# EAGLE board powermodule (EAGLE 9.6.2)
PCB_VERSION: Powermodule V6.2.1
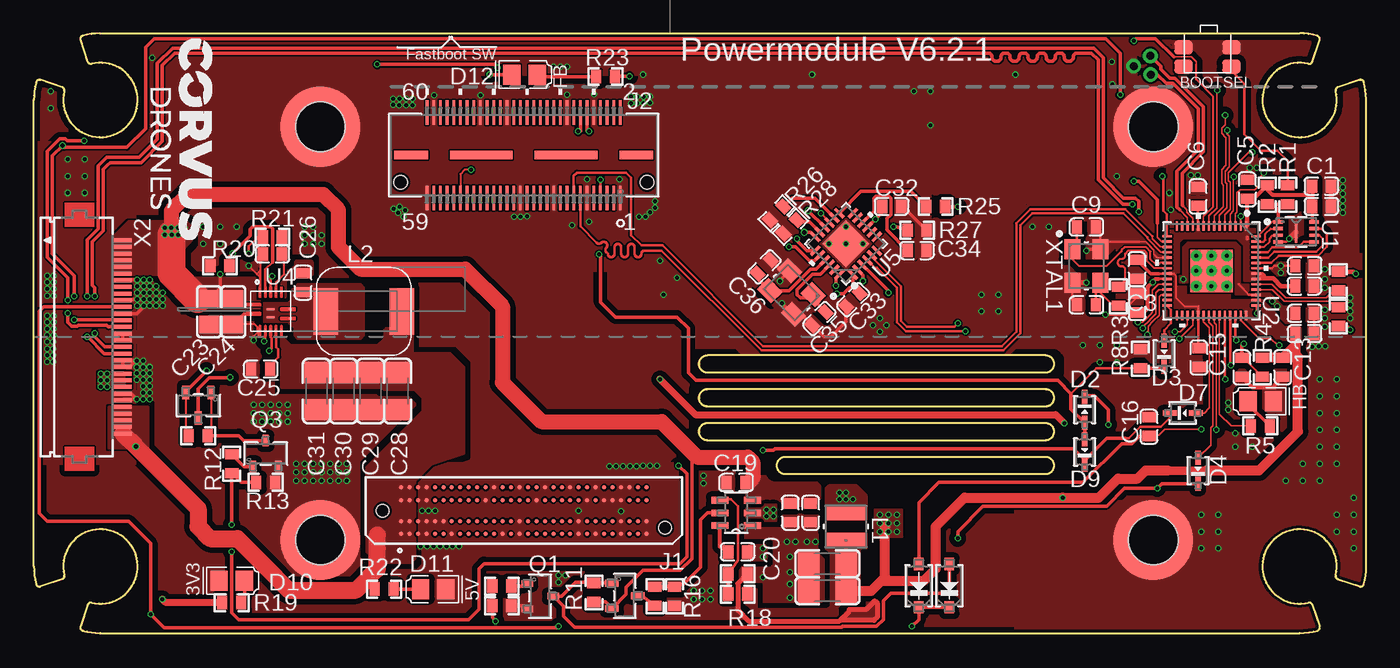
[diagram p11: board, top side]
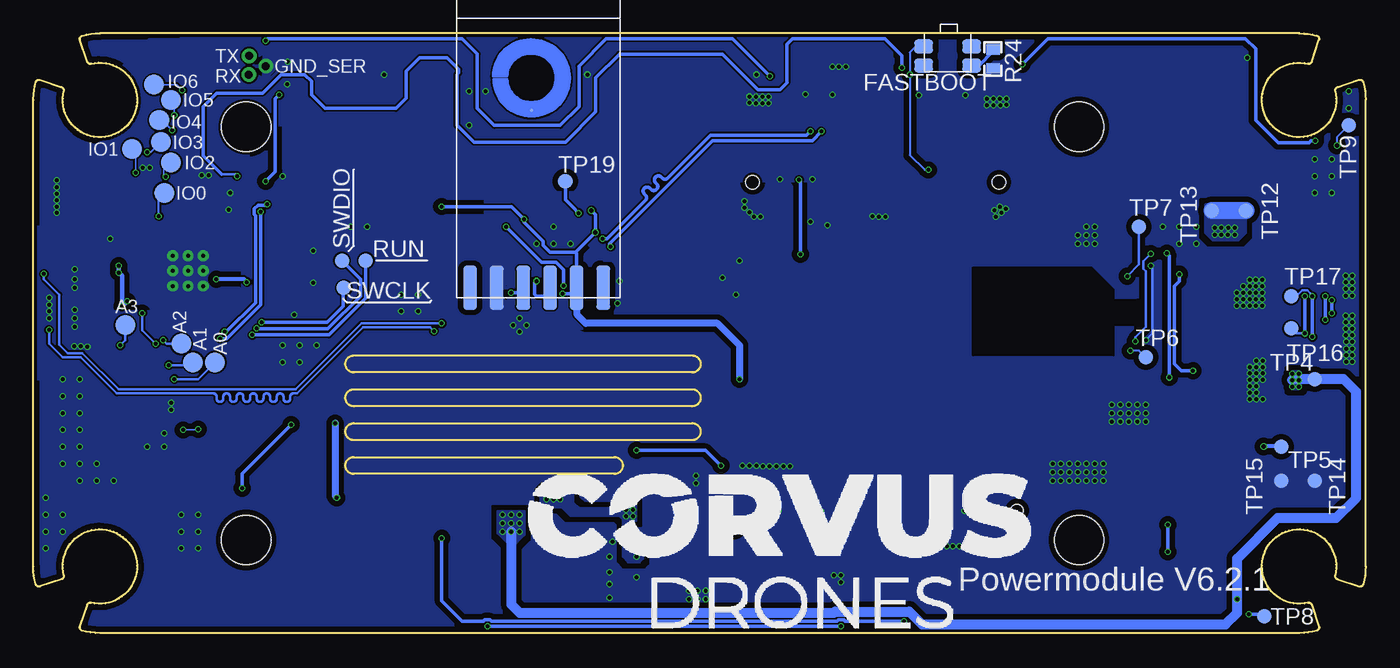
[diagram p12: board, bottom side, seen from below]

Size 100 x 45 mm. Coordinates in mm from the lower left corner, seen from the top.
Outline: 99.81,3.65 arc-88 99.5,3.5 97.88,4.04 arc-85 97.71,4.34 arc170 92.44,6.11 92.35,5.88 arc122 95.66,2.29 arc-85 95.96,2.12 96.5,0.5 arc-83 96.37,0.19 96.37,0.19 arc-16 95,0 5,0 4.95,0 arc-15 3.67,0.18 arc-93 3.5,0.5 4.04,2.12 arc-85 4.34,2.29 arc122 7.65,5.88 7.56,6.11 arc170 2.29,4.34 arc-85 2.12,4.04 0.5,3.5 arc-93 0.18,3.67 arc-15 0,5 0,40 arc-15 0.18,41.33 arc-93 0.5,41.5 2.12,40.96 arc-85 2.29,40.66 arc170 7.56,38.89 7.65,39.12 arc122 4.34,42.71 arc-85 4.04,42.88 3.5,44.5 arc-93 3.67,44.82 arc-15 4.95,45 5,45 95,45 arc-16 96.34,44.82
Outline: 99.81,3.65 99.81,3.65
Outline: 99.81,3.65 arc16 100,5 100,40 99.98,40.44 arc10 99.82,41.32 arc94 99.5,41.5 97.88,40.96 arc85 97.71,40.66 arc-117 94.35,37.28 94.12,37.35 arc-175 95.65,42.72 95.67,42.71 arc84 95.96,42.88 96.5,44.5 arc91 96.34,44.82
Outline: 96.34,44.82 96.34,44.82
Copper layers (1*16): Top 0.035mm / dielectric 1.6mm / Bottom 0.035mm
Design rules "jlcpcb-2layers *": minimum track width 5mil, minimum drill 0.3mm, track to track 5mil, track to pad 5mil, pad to pad 5mil, via to via 5mil, smd to smd 5mil, copper to edge 0.2mm, drill to drill 6mil, minimum pad ring 10mil, minimum via ring 3mil, stop-mask expansion 4mil, vias tented up to drill 0.35mm, thermal gap 10mil
tRestrict: area 49.7,19.6 to 76.8,20.8; area 49.7,17 to 76.8,18.3; area 49.7,14.5 to 76.8,15.7; area 55.5,11.9 to 76.7,13.2
Milling: 24 lines

## Footprints (pad centres in the part's own frame; a part is rotated, then mirrored left to right if it is on the bottom)
C0603 = smd 0.762 x 1.001: 1 -0.711,0; 2 0.711,0
C1206 = smd 1.6 x 1.8: 1 -1.4,0; 2 1.4,0
C0805 = smd 1.3 x 1.5: 1 -0.95,0; 2 0.95,0
LED_0805 = smd 1.3 x 1.5: A -0.95,0; C 0.95,0
SOD323_NEX-L = smd 1.054 x 0.406: 1 -0.972,0; 2 0.972,0
SOD-123_ONS-L = smd 0.914 x 0.711: 1 -1.626,0; 2 1.626,0
TH-0.75/0.6 = drill 0.6 pad 0.75: P$2 0,0
SMT_SPACER_5MMX2.5M = smd 6 x 6: P$1 0,0 | hole 3.7: 0,0
SAMTEC_ADM6-30-01.5-L-4-2-A-TR = smd 0.356 x 0.356: A01 9.207,1.75; A02 8.572,1.75; A03 7.938,1.75; A04 7.303,1.75; A05 6.668,1.75; A06 6.032,1.75; A07 5.397,1.75; A08 4.763,1.75; A09 4.128,1.75; A10 3.493,1.75; A11 2.857,1.75; A12 2.223,1.75; A13 1.587,1.75; A14 0.953,1.75; A15 0.318,1.75; A16 -0.318,1.75; A17 -0.953,1.75; A18 -1.587,1.75; A19 -2.223,1.75; A20 -2.857,1.75; A21 -3.493,1.75; A22 -4.128,1.75; A23 -4.763,1.75; A24 -5.397,1.75; A25 -6.032,1.75; A26 -6.668,1.75; A27 -7.303,1.75; A28 -7.938,1.75; A29 -8.572,1.75; A30 -9.207,1.75; B01 9.207,0.79; B02 8.572,0.79; B03 7.938,0.79; B04 7.303,0.79; B05 6.668,0.79; B06 6.032,0.79; B07 5.397,0.79; B08 4.763,0.79; B09 4.128,0.79; B10 3.493,0.79; B11 2.857,0.79; B12 2.223,0.79; B13 1.587,0.79; B14 0.953,0.79; B15 0.318,0.79; B16 -0.318,0.79; B17 -0.953,0.79; B18 -1.587,0.79; B19 -2.223,0.79; B20 -2.857,0.79; B21 -3.493,0.79; B22 -4.128,0.79; B23 -4.763,0.79; B24 -5.397,0.79; B25 -6.032,0.79; B26 -6.668,0.79; B27 -7.303,0.79; B28 -7.938,0.79; B29 -8.572,0.79; B30 -9.207,0.79; C01 9.207,-0.79; C02 8.572,-0.79; C03 7.938,-0.79; C04 7.303,-0.79; C05 6.668,-0.79; C06 6.032,-0.79; C07 5.397,-0.79; C08 4.763,-0.79; C09 4.128,-0.79; C10 3.493,-0.79; C11 2.857,-0.79; C12 2.223,-0.79; C13 1.587,-0.79; C14 0.953,-0.79; C15 0.318,-0.79; C16 -0.318,-0.79; C17 -0.953,-0.79; C18 -1.587,-0.79; C19 -2.223,-0.79; C20 -2.857,-0.79; C21 -3.493,-0.79; C22 -4.128,-0.79; C23 -4.763,-0.79; C24 -5.397,-0.79; C25 -6.032,-0.79; C26 -6.668,-0.79; C27 -7.303,-0.79; C28 -7.938,-0.79; C29 -8.572,-0.79; C30 -9.207,-0.79; D01 9.207,-1.75; D02 8.572,-1.75; D03 7.938,-1.75; D04 7.303,-1.75; D05 6.668,-1.75; D06 6.032,-1.75; D07 5.397,-1.75; D08 4.763,-1.75; D09 4.128,-1.75; D10 3.493,-1.75; D11 2.857,-1.75; D12 2.223,-1.75; D13 1.587,-1.75; D14 0.953,-1.75; D15 0.318,-1.75; D16 -0.318,-1.75; D17 -0.953,-1.75; D18 -1.587,-1.75; D19 -2.223,-1.75; D20 -2.857,-1.75; D21 -3.493,-1.75; D22 -4.128,-1.75; D23 -4.763,-1.75; D24 -5.397,-1.75; D25 -6.032,-1.75; D26 -6.668,-1.75; D27 -7.303,-1.75; D28 -7.938,-1.75; D29 -8.572,-1.75; D30 -9.207,-1.75 | hole 0.95: 10.61,0; -10.61,1.27
CONN_QTH-030-02-L-D-A-K-FR_S00 = smd 0.203 x 1.829: 1 7.252,-3.2; 2 7.252,3.2; 3 6.752,-3.2; 4 6.752,3.2; 5 6.252,-3.2; 6 6.252,3.2; 7 5.751,-3.2; 8 5.751,3.2; 9 5.251,-3.2; 10 5.251,3.2; 11 4.751,-3.2; 12 4.751,3.2; 13 4.251,-3.2; 14 4.251,3.2; 15 3.751,-3.2; 16 3.751,3.2; 17 3.251,-3.2; 18 3.251,3.2; 19 2.751,-3.2; 20 2.751,3.2; 21 2.251,-3.2; 22 2.251,3.2; 23 1.75,-3.2; 24 1.75,3.2; 25 1.25,-3.2; 26 1.25,3.2; 27 0.75,-3.2; 28 0.75,3.2; 29 0.25,-3.2; 30 0.25,3.2; 31 -0.25,-3.2; 32 -0.25,3.2; 33 -0.75,-3.2; 34 -0.75,3.2; 35 -1.25,-3.2; 36 -1.25,3.2; 37 -1.75,-3.2; 38 -1.75,3.2; 39 -2.251,-3.2; 40 -2.251,3.2; 41 -2.751,-3.2; 42 -2.751,3.2; 43 -3.251,-3.2; 44 -3.251,3.2; 45 -3.751,-3.2; 46 -3.751,3.2; 47 -4.251,-3.2; 48 -4.251,3.2; 49 -4.751,-3.2; 50 -4.751,3.2; 51 -5.251,-3.2; 52 -5.251,3.2; 53 -5.751,-3.2; 54 -5.751,3.2; 55 -6.252,-3.2; 56 -6.252,3.2; 57 -6.752,-3.2; 58 -6.752,3.2; 59 -7.252,-3.2; 60 -7.252,3.2 | smd 4.699 x 0.635: 61 3.175,0; 62 -3.175,0 | smd 2.54 x 0.635: 63 8.445,0; 64 -8.445,0 | hole 1.016: -9.246,-2.032; 9.246,-2.032
IND_VLS3012HBX-3R3M_TDK-L = smd 1.168 x 3.048: 1 -1.041,0; 2 1.041,0
HA72L-06301R5LFTR = smd 1.85 x 3.5: P$1 -2.85,0; P$2 2.85,0
TO-236AB_NEX-L = smd 0.483 x 0.864: 1 -0.953,-0.978; 2 0.953,-0.978; 3 0,0.978
TO-236_VIS-L = smd 0.508 x 1.016: 1 -0.95,-0.965; 2 0.95,-0.965; 3 0,0.965
R0603 = smd 0.762 x 1.001: 1 -0.711,0; 2 0.711,0
EVQ-P7J01P = smd 1.4 x 1.05: 1 0,1.45; 2 3.6,1.45; 3 0,0; 4 3.6,0
TP11R = smd 1.1 x 1.1: TP 0,0
W25Q16JVUXIQ_WIN-L = smd 0.711 x 0.254: 1 -1.348,0.75; 2 -1.348,0.25; 3 -1.348,-0.25; 4 -1.348,-0.75; 5 1.348,-0.75; 6 1.348,-0.25; 7 1.348,0.25; 8 1.348,0.75 | smd 0.203 x 1.6: 9 0,0
RP2040TR7_RPI-L = smd 0.711 x 0.178: 1 -3.353,2.6; 2 -3.353,2.2; 3 -3.353,1.8; 4 -3.353,1.4; 5 -3.353,1; 6 -3.353,0.6; 7 -3.353,0.2; 8 -3.353,-0.2; 9 -3.353,-0.6; 10 -3.353,-1; 11 -3.353,-1.4; 12 -3.353,-1.8; 13 -3.353,-2.2; 14 -3.353,-2.6; 29 3.353,-2.6; 30 3.353,-2.2; 31 3.353,-1.8; 32 3.353,-1.4; 33 3.353,-1; 34 3.353,-0.6; 35 3.353,-0.2; 36 3.353,0.2; 37 3.353,0.6; 38 3.353,1; 39 3.353,1.4; 40 3.353,1.8; 41 3.353,2.2; 42 3.353,2.6 | smd 0.178 x 0.711: 15 -2.6,-3.353; 16 -2.2,-3.353; 17 -1.8,-3.353; 18 -1.4,-3.353; 19 -1,-3.353; 20 -0.6,-3.353; 21 -0.2,-3.353; 22 0.2,-3.353; 23 0.6,-3.353; 24 1,-3.353; 25 1.4,-3.353; 26 1.8,-3.353; 27 2.2,-3.353; 28 2.6,-3.353; 43 2.6,3.353; 44 2.2,3.353; 45 1.8,3.353; 46 1.4,3.353; 47 1,3.353; 48 0.6,3.353; 49 0.2,3.353; 50 -0.2,3.353; 51 -0.6,3.353; 52 -1,3.353; 53 -1.4,3.353; 54 -1.8,3.353; 55 -2.2,3.353; 56 -2.6,3.353 | smd 3.2 x 3.2: 57 0,0 | drill 0.3 pad 0.61: 58 -1.143,1.143; 59 -1.143,0; 60 -1.143,-1.143; 61 0,-1.143; 62 1.143,-1.143; 63 1.143,0; 64 1.143,1.143; 65 0,1.143; 66 0,0
DDC0006A_L = smd 1.27 x 0.508: 1 -1.219,0.95; 2 -1.219,0; 3 -1.219,-0.95; 4 1.219,-0.95; 5 1.219,0; 6 1.219,0.95
RT7291AGQUF = smd 0.1 x 0.1: P$1 -1.4,0.525; P$2 -1.4,-0.175; P$3 -0.8,-1.4; P$4 -0.4,-1.4; P$5 0,-1.4; P$6 0.4,-1.4; P$7 0.8,-1.4; P$8 1.4,-0.525; P$9 1.4,0.175; P$10 0.8,1.4; P$11 0.4,1.4; P$12 0,1.4; P$13 -0.4,1.4; P$14 -0.8,1.4 | smd 0.6 x 0.15: P$15 0,0.165; P$16 0,-0.435
SQFN24_4X4 = smd 0.914 x 0.254: 1 -1.994,1.27; 2 -1.994,0.762; 3 -1.994,0.254; 4 -1.994,-0.254; 5 -1.994,-0.762; 6 -1.994,-1.27; 13 1.994,-1.27; 14 1.994,-0.762; 15 1.994,-0.254; 16 1.994,0.254; 17 1.994,0.762; 18 1.994,1.27 | smd 0.254 x 0.914: 7 -1.27,-1.994; 8 -0.762,-1.994; 9 -0.254,-1.994; 10 0.254,-1.994; 11 0.762,-1.994; 12 1.27,-1.994; 19 1.27,1.994; 20 0.762,1.994; 21 0.254,1.994; 22 -0.254,1.994; 23 -0.762,1.994; 24 -1.27,1.994 | smd 2.489 x 2.489: 25 0,0
WIFI-RTL8188EUS = smd 1.016 x 3.302: GND -3.117,0.762; IO1 4.883,0.762; IO2 -5.117,0.762; USB-DM 0.883,0.762; USB-DP -1.117,0.762; VDD33 2.883,0.762 | smd 0.254 x 0.254: P$1 -0.508,14.097
FH12-30S-0.5SH = smd 0.3 x 1.3: 1 -7.25,3.25; 2 -6.75,3.25; 3 -6.25,3.25; 4 -5.75,3.25; 5 -5.25,3.25; 6 -4.75,3.25; 7 -4.25,3.25; 8 -3.75,3.25; 9 -3.25,3.25; 10 -2.75,3.25; 11 -2.25,3.25; 12 -1.75,3.25; 13 -1.25,3.25; 14 -0.75,3.25; 15 -0.25,3.25; 16 0.25,3.25; 17 0.75,3.25; 18 1.25,3.25; 19 1.75,3.25; 20 2.25,3.25; 21 2.75,3.25; 22 3.25,3.25; 23 3.75,3.25; 24 4.25,3.25; 25 4.75,3.25; 26 5.25,3.25; 27 5.75,3.25; 28 6.25,3.25; 29 6.75,3.25; 30 7.25,3.25
SMT-PAD_R1-5MM = smd 1.5 x 1.5: P$1 0,0
SMD3225_3.2X2.5X0.7_MTC-L = smd 1.194 x 1.499: 1 -1.054,1.257; 2 -1.054,-1.257; 3 1.054,-1.257; 4 1.054,1.257

## Placement (x,y rotation side)
C1  100nF  [C0603]  96.65,33.53 0 top
C2  2u2F  [C0603]  96.65,32 0 top
C3  100nF  [C0603]  82.8,27.3 90 top
C4  2u2F  [C0603]  95.38,24 180 top
C5  100nF  [C0603]  91.08,33.3 90 top
C6  100nF  [C0603]  87.38,32.77 90 top
C7  2u2F  [C0603]  95.38,22.48 180 top
C8  100nF  [C0603]  82.8,24.77 90 top
C9  10pF  [C0603]  78.99,30.48 180 top
C10  10pF  [C0603]  78.99,24.64 180 top
C11  2u2F  [C0603]  90.68,19.94 90 top
C12  100nF  [C0603]  95.38,26.04 0 top
C13  100nF  [C0603]  93.73,19.94 270 top
C14  100nF  [C0603]  95.38,27.56 180 top
C15  100nF  [C0603]  87.45,20.68 90 top
C16  100nF  [C0603]  83.69,15.49 90 top
C17  10uF  [C0603]  56.77,9.02 270 top
C18  10uF  [C0603]  58.29,9.02 270 top
C19  100nF  [C0603]  52.7,11.3 180 top
C20  100nF  [C0603]  52.83,6.1 0 top
C21  22uF  [C1206]  59.56,3.17 180 top
C22  22uF  [C1206]  59.56,5.21 180 top
C23  10uF  [C0805]  13.15,24.11 270 top
C24  10uF  [C0805]  14.97,24.11 270 top
C25  4u7F  [C0603]  17.02,19.81 180 top
C26  100nF  [C0603]  20.19,26.29 270 top
C27  2u2F  [C0603]  17.91,28.45 180 top
C28  22uF  [C1206]  27.3,18.16 270 top
C29  22uF  [C1206]  25.27,18.16 270 top
C30  22uF  [C1206]  23.24,18.16 270 top
C31  22uF  [C1206]  21.21,18.16 270 top
C32  1uF  [C0603]  64.39,32 0 top
C33  100nF  [C0603]  61.47,25.02 225 top
C34  1uF  [C0603]  66.29,28.7 0 top
C35  10pF  [C0603]  58.93,23.6 225 top
C36  10pF  [C0603]  54.81,27.48 225 top
D1  YL  [LED_0805]  92.08,17.4 0 top
D2  1N4148WS  [SOD323_NEX-L]  78.87,16.76 270 top
D3  1N4148WS  [SOD323_NEX-L]  84.84,20.95 90 top
D4  1N4148WS  [SOD323_NEX-L]  87.38,12.19 90 top
D5  [SOD-123_ONS-L]  66.42,3.56 90 top
D6  [SOD-123_ONS-L]  68.71,3.56 90 top
D7  1N4148WS  [SOD323_NEX-L]  86.23,16.51 0 top
D9  1N4148WS  [SOD323_NEX-L]  78.87,13.59 90 top
D10  GN  [LED_0805]  14.86,3.94 180 top
D11  BL  [LED_0805]  29.97,3.3 0 top
D12  YL  [LED_0805]  36.83,41.91 180 top
GND_SER  TH-0.75/0.6  [TH-0.75/0.6]  82.55,42.55 0 bottom
H1  SMT_SPACER_5MMX2.5M  [SMT_SPACER_5MMX2.5M]  21.52,6.99 0 top
H2  SMT_SPACER_5MMX2.5M  [SMT_SPACER_5MMX2.5M]  21.52,37.99 0 top
H3  SMT_SPACER_5MMX2.5M  [SMT_SPACER_5MMX2.5M]  84.02,37.99 0 top
H4  SMT_SPACER_5MMX2.5M  [SMT_SPACER_5MMX2.5M]  84.02,6.99 0 top
J1  ADM6-30-01.5-L-4-2-A-TR  [SAMTEC_ADM6-30-01.5-L-4-2-A-TR]  36.77,9.19 180 top
J2  QTH-030-01-L-D-ACONN_QTH-030-02-L-D-A-K-FR_S00  [CONN_QTH-030-02-L-D-A-K-FR_S00]  36.77,35.86 0 top
L1  VLS3012HBX-3R3MIND_VLS3012HBX-3R3M_TDK-L  [IND_VLS3012HBX-3R3M_TDK-L]  60.96,8 90 top
L2  [HA72L-06301R5LFTR]  24.77,24.13 180 top
Q1  2N7002,215TO-236AB_NEX-L  [TO-236AB_NEX-L]  38,2.77 270 top
Q2  SI2301CDS-T1-GE3TO-236_VIS-L  [TO-236_VIS-L]  44.35,2.79 270 top
Q3  2N7002,215TO-236AB_NEX-L  [TO-236AB_NEX-L]  17.4,13.46 0 top
Q4  SI2301CDS-T1-GE3TO-236_VIS-L  [TO-236_VIS-L]  12.34,17.09 180 top
R1  1K  [R0603]  94.11,32.89 270 top
R2  10k  [R0603]  92.58,32.89 90 top
R3  1K  [R0603]  81.41,25.27 270 top
R4  200R  [R0603]  92.2,19.94 90 top
R5  200R  [R0603]  92.05,15.54 180 top
R6  27R  [R0603]  97.92,23.75 270 top
R7  27R  [R0603]  97.92,26.42 90 top
R8  10k  [R0603]  83.06,20.57 270 top
R9  4k7  [R0603]  35.13,3.53 180 top
R10  100k  [R0603]  35.13,2.06 0 top
R11  100k  [R0603]  42.04,3.05 90 top
R12  4k7  [R0603]  14.86,12.7 270 top
R13  100k  [R0603]  17.4,11.3 0 top
R14  100k  [R0603]  12.34,14.81 0 top
R15  10k  [R0603]  46.61,2.77 90 top
R16  100k  [R0603]  48.08,2.77 90 top
R17  10k  [R0603]  52.83,4.45 180 top
R18  33k2  [R0603]  52.83,2.92 0 top
R19  200R  [R0603]  14.86,2.29 180 top
R20  100k  [R0603]  13.97,27.56 0 top
R21  100k  [R0603]  17.91,29.72 0 top
R22  200R  [R0603]  26.29,3.3 180 top
R23  200R  [R0603]  42.9,41.76 0 top
R24  1K  [R0603]  27.97,43.08 270 bottom
R25  50k  [R0603]  67.69,32 0 top
R26  50k  [R0603]  55.75,31.5 225 top
R27  12k  [R0603]  66.29,30.23 0 top
R28  50k  [R0603]  56.77,30.48 225 top
SW1  BOOTSEL  [EVQ-P7J01P]  86.28,42.49 0 top
SW2  FASTBOOT  [EVQ-P7J01P]  33.17,42.57 0 bottom
SWCLK  TPTP11R  [TP11R]  76.71,25.91 90 bottom
SWDIO  TPTP11R  [TP11R]  76.83,27.94 270 bottom
TP4  TPTP11R  [TP11R]  3.81,19.05 0 bottom
TP5  TPTP11R  [TP11R]  6.35,13.97 0 bottom
TP6  TPTP11R  [TP11R]  16.51,20.7 0 bottom
TP7  TPTP11R  [TP11R]  17.02,30.48 0 bottom
TP8  TPTP11R  [TP11R]  7.62,1.27 0 bottom
TP9  TPTP11R  [TP11R]  1.27,38.1 0 bottom
TP11  TPTP11R  [TP11R]  75.06,27.94 270 bottom
TP12  TPTP11R  [TP11R]  8.99,31.7 90 bottom
TP13  TPTP11R  [TP11R]  11.53,31.7 90 bottom
TP14  TPTP11R  [TP11R]  3.81,11.43 270 bottom
TP15  TPTP11R  [TP11R]  6.35,11.43 270 bottom
TP16  TPTP11R  [TP11R]  5.59,22.86 270 bottom
TP17  TPTP11R  [TP11R]  5.59,25.27 270 bottom
TP19  TPTP11R  [TP11R]  60.07,33.91 0 bottom
U1  W25Q16JVUXIQW25Q16JVUXIQ_WIN-L  [W25Q16JVUXIQ_WIN-L]  94.74,30.1 0 top
U2  RP2040  [RP2040TR7_RPI-L]  88.39,27.18 270 top
U3  TPS563201DDCR  [DDC0006A_L]  52.7,9.02 180 top
U4  RT7291AGQUF  [RT7291AGQUF]  17.78,24.13 0 top
U5  USB2422/MJ_SQFN-4X4  [SQFN24_4X4]  60.96,29.21 135 top
W1  WIFI-RTL8188EUS  [WIFI-RTL8188EUS]  62.1,25.15 0 bottom
X2  FH12-30S-0.5SH  [FH12-30S-0.5SH]  3.43,22.23 270 top
X3  TH-0.75/0.6  [TH-0.75/0.6]  83.79,43.31 0 bottom
X4  TH-0.75/0.6  [TH-0.75/0.6]  83.82,41.91 0 bottom
XP1  SMT-PAD_R1-5MM  [SMT-PAD_R1-5MM]  90.17,33.02 0 bottom
XP2  SMT-PAD_R1-5MM  [SMT-PAD_R1-5MM]  89.66,35.31 0 bottom
XP3  SMT-PAD_R1-5MM  [SMT-PAD_R1-5MM]  90.42,36.83 0 bottom
XP4  SMT-PAD_R1-5MM  [SMT-PAD_R1-5MM]  90.55,38.48 0 bottom
XP5  SMT-PAD_R1-5MM  [SMT-PAD_R1-5MM]  89.66,40.01 0 bottom
XP6  SMT-PAD_R1-5MM  [SMT-PAD_R1-5MM]  86.36,20.32 0 bottom
XP7  SMT-PAD_R1-5MM  [SMT-PAD_R1-5MM]  88.01,20.32 0 bottom
XP8  SMT-PAD_R1-5MM  [SMT-PAD_R1-5MM]  88.9,21.72 0 bottom
XP9  SMT-PAD_R1-5MM  [SMT-PAD_R1-5MM]  93.09,23.11 0 bottom
XP10  SMT-PAD_R1-5MM  [SMT-PAD_R1-5MM]  90.93,41.15 0 bottom
XP11  SMT-PAD_R1-5MM  [SMT-PAD_R1-5MM]  92.58,36.32 0 bottom
XTAL1  12MHz  [SMD3225_3.2X2.5X0.7_MTC-L]  78.99,27.56 0 top
XTAL2  24MHz  [SMD3225_3.2X2.5X0.7_MTC-L]  56.87,25.55 225 top

## Tracks (layer width: path | path; a pad name or v marks a point on that pad's centre or on a via)
+1V1  (via drill 0.3)
  Top 0.178: U2.50 92.91,27.38 93.09,27.56 C14.2 | 84.38,26.57 85.03,26.57 U2.23 | U2.45 91.21,25.38 90.42,26.16
  Top 0.305: C8.1 83.31,24.05 83.62,24.36 83.62,25.98 v83.97,26.34 84.2,26.57 84.38,26.57
  Bottom 0.305: v86.26,26.54 86.23,26.57 84.2,26.57 v83.97,26.34
  Bottom 0.33: v92.96,24.89 v93.34,24.51 93.34,26.8 v93.6,27.05 v93.6,27.56
  pour Top (no thermals): 95,24.51 93.73,24.51 92.71,25.53 91.69,25.53 91.69,25.27 92.46,25.27 93.6,24.13 93.6,23.62 93.98,23.24 95,23.24
  pour Top: 93.98,27.81 93.98,26.8 93.34,26.8 92.84,27.3 93.34,27.81
  pour Top: 91.19,26.16 91.19,25.4 90.17,25.4 90.17,28.83 90.04,28.96 86.74,28.96 86.61,28.83 86.61,26.29 85.98,26.29 85.98,26.8 86.23,26.8 86.23,28.96 86.61,29.34 90.17,29.34 90.55,28.96 90.55,26.16
+3V3  (via drill 0.3, 0.35)
  Top 0.152: 91.03,30.57 U2.1 | 87.39,24.51 86.36,24.51 85.72,25.15 85.72,26.8 85.54,26.98
  Top 0.178: U2.49 92.28,26.98 92.33,26.92 92.33,26.8 92.11,26.58 U2.48 | 87.39,24.51 U2.33 87.39,21.45 C15.2 | C21.1 C22.1 L1.1 | 84.45,26.98 U2.22 85.54,26.98 | U2.10 87.38,30.55 C6.1
  Top 0.254: 91.06,29.59 91.06,29.72 | U1.8 95.94,31 C2.1 | C3.2 83.84,26.98 84.45,26.98 | U5.16 v58.11,31.7 | v57.82,30.07 58.31,30.07 U5.18 | C32.1 63.68,31.57 v63.17,31.06 U5.9 | 86.49,12.19 86.36,12.19 | R25.2 v69.36,32 | v60.29,25.46 60.77,25.46 61.21,25.91 61.59,25.91 C33.1 61.47,26.02 U5.1
  Top 0.305: 91.03,30.57 91.08,30.62 C5.1 91.57,32.59 R2.2 92.58,33.27 92.96,32.89 95.5,32.89 | 95.5,32.89 95.94,33.33 C1.1 C2.1 95.89,32.05 95.89,32.51 95.5,32.89
  Top 0.33: C12.1 93.61,26.04 93.01,26.63 92.14,26.63 92.08,26.7 92.08,26.92 92.2,26.92 92.33,26.8
  Top 0.508: v46.99,19.05 49.66,16.38 76.71,16.38 v77.34,15.75 | R19.2 9.91,2.29 v9.65,2.54
  Top 0.635: 85.09,12.19 86.36,12.19 88.01,12.19
  Top 0.762: C13.1 94.67,21.59 C7.2 94.67,20.9 94.87,20.7 | C13.1 R4.2 | 94.87,20.7 94.87,15.11 91.95,12.19 88.01,12.19 | C13.1 93.78,20.7 94.87,20.7 | C21.1 62.87,3.17 63.63,3.94 | 63.63,3.94 63.88,4.19 63.88,7.98 | 63.63,3.94 66.81,3.94 67.69,4.82 67.69,8 69.85,10.16 v77.22,10.16 79.94,10.16 81.38,11.6 82.84,11.6 83.44,12.19 85.09,12.19
  Bottom 0.254: v58.11,31.7 57.82,31.4 v57.82,30.07 59.31,28.57 | v60.29,25.46 59.11,25.46 | 59.31,28.57 61.21,28.57 61.75,29.11 61.75,29.41 63.17,30.83 v63.17,31.06 64.11,32 v69.36,32 | W1.VDD33 59.22,28.49 59.31,28.57
  Bottom 0.305: TP4.TP 5.08,19.05
  Bottom 0.508: W1.VDD33 59.13,25.54 | 59.13,25.54 59.11,25.46 | v46.99,19.05 46.99,21.59 48.64,23.24 58.55,23.24 59.18,23.88 59.18,25.49 59.13,25.54 | v77.34,15.75 77.34,10.29 v77.22,10.16
  Bottom 0.762: v64.14,7.62 64.14,2.16 63.49,1.52 39.93,1.52 39.83,1.62 34.26,1.62 33.3,0.66 10.52,0.66 9.65,1.52 v9.65,2.54 9.65,5.59 6.6,8.64 2.21,8.64 0.72,10.12 0.72,18.12 1.65,19.05 5.08,19.05 5.44,19.05 v5.51,18.97
  other vias: 5.03,19.46 5.03,18.97 5.51,19.46 5.03,18.49 5.51,18.49 63.5,7.62 63.5,8.89 64.77,8.89 64.77,7.62 63.5,8.26 64.77,8.26 64.14,8.26 64.14,8.89
  pour Top (no thermals): 95,22.99 93.85,22.99 93.34,23.5 93.34,23.88 92.2,25.02 91.06,25.02 91.06,22.99 91.95,22.1 93.6,22.1 93.73,21.97 95,21.97 95.12,22.1 95.12,22.86
  pour Top (rank 5, no thermals): 91.69,30.35 91.69,26.42 90.81,26.42 90.81,29.08 90.3,29.59 86.23,29.59 85.98,29.34 85.98,27.05 85.72,27.05 85.72,26.04 86.49,26.04 86.49,25.4 89.79,25.4 89.79,25.02 92.2,25.02 92.46,24.77 92.46,23.75 92.2,23.5 91.06,23.5 90.93,23.62 90.93,24 85.22,24 85.22,30.35
  pour Top (no thermals): 62.48,7.62 59.31,7.62 59.31,6.48 59.82,5.97 59.82,2.03 59.56,1.78 54.23,1.78 54.23,3.3 53.34,3.3 53.34,2.29 53.85,1.78 53.85,1.27 60.33,1.27 60.33,1.91 60.58,2.16 61.72,2.16 61.98,2.41 61.98,6.22 62.1,6.35 62.48,6.35
  pour Top (no thermals): 90.93,30.99 90.93,29.72 91.19,29.72 91.19,31.37 91.06,31.11
  pour Top (rank 2, no thermals): 4.95,19.53 6.76,19.53 6.76,18.47 4.9,18.47 4.9,19.48
  pour Bottom: 5,19.46 5.49,19.46 5.49,18.49 5.03,18.49 5.03,19.41 4.98,19.46
  pour Top: 63.12,9.14 63.12,7.24 65.15,7.24 65.15,9.27 63.12,9.27
  pour Bottom: 63.12,9.14 63.12,7.37 63.75,6.73 64.39,6.73 65.15,7.49 65.15,8.13 65.15,9.14
+5V  (via drill 0.35)
  Top 0.254: R22.2 25.58,6.15 25.78,6.35
  Top 1.27: 25.78,7.37 25.78,6.35 25.78,4.83 24.18,3.23 19.13,3.23 17.27,5.08 17.27,5.11 15.29,7.08 13.24,7.08 12.32,8 12.32,9.34 v7.65,14 X2.30
  Bottom 0.305: TP5.TP 6.38,14 v7.65,14
  pour Top (rank 4, no thermals): 18.54,23.11 18.54,18.41 28.45,18.41 28.45,22.86 26.42,22.86 26.29,22.73 26.29,22.1 25.78,21.59 19.3,21.59 18.67,22.23 18.67,23.11
  pour Top (rank 2, no thermals): 5.69,16.94 8.51,16.94 8.51,13.89 5.69,13.89
  pour Top (no thermals): 26.29,18.29 28.57,18.29 29.21,17.65 29.21,16.64 25.02,12.45 25.02,6.1 25.78,5.33 28.32,5.33 28.57,5.59 28.57,11.43 29.84,12.7 32.26,13.5 32.26,19.94 31.24,20.95 26.54,20.95 26.04,20.45 26.04,18.54
+12V  (via drill 0.3)
  Top 0.152: Q4.2 11.39,15.05 R14.1
  Top 0.254: Q4.2 11.39,18.12 v12.95,19.68 | C23.1 13.97,25.88 v13.97,26.92 | C23.1 12.28,25.06 | C23.1 C24.1 | 49.78,13.21 49.4,12.83 49.4,5.59 48.51,4.7 45.72,4.7 44.45,3.43 44.45,2.91 Q2.2 42.89,2.34 R11.1
  Top 0.381: 53.69,11.34 C19.1
  Top 1.143: v10.31,30.4 10.31,31.67 11.53,32.89 21.72,32.89 22.86,31.75 22.86,28.96 24.51,27.3 32.38,27.3 35.18,24.51 35.18,18.8 38.1,15.88 47.12,15.88 49.78,13.21 53.59,13.21 53.98,12.83 53.98,11.62 53.69,11.34
  Top 2.108: v10.34,29.9 10.34,27 12.28,25.06
  Bottom 0.254: v12.95,19.68 13.84,19.68 14.35,20.19 14.35,26.04 13.97,26.42 v13.97,26.92
  Bottom 1.27: TP12.TP TP13.TP
  other vias: 9.8,30.4 10.82,30.4 11.33,30.4 11.33,29.9 10.82,29.9 9.83,29.9
  pour Top (isolate 0.508, no thermals): 58.29,11.81 53.47,11.81 53.47,9.65 54.48,9.65 54.74,9.91 56.01,9.91 56.01,9.65 56.13,9.53 58.93,9.53 59.05,9.65 59.05,11.05
  pour Bottom (rank 5, no thermals): 9.04,32.16 9.04,30.05 9.58,29.51 11.48,29.51 12.01,30.05 12.01,32.16
  pour Top (rank 5, no thermals): 11.43,26.67 11.43,24.38 17.02,24.38 17.02,24.89 16.76,24.89 16.64,25.02 16.64,26.67
  pour Top (rank 2, no thermals): 6.1,26.92 6.1,29.84 7.11,30.86 11.43,30.86 11.81,30.48 11.81,29.46 11.68,29.34 9.27,26.92
ADC_AVDD  (via drill 0.3)
  Top 0.152: 91.82,24.13 91.82,24.5 U2.43
  Top 0.178: 91.82,24.45 91.82,24.5
  Top 0.203: R4.1 90.78,20.65 C11.2
  Top 0.254: C11.2 90.68,21.59 v90.81,21.72 | v91.82,24 91.82,24.13 91.82,24.45
  Bottom 0.203: v91.82,24 91.82,22.73 v90.81,21.72
D_N  (via drill 0.3)
  Top 0.178: U5.4 63.12,27.41 63.27,27.41 64.77,25.9 64.77,23.32 65.44,22.65 v69.93,22.65
  Top 0.33: R6.2 98.52,23.04 v98.81,22.74
  Bottom 0.178: v69.93,22.65 70.21,22.93 75.24,22.93 80.19,17.98 80.48,17.98 arc-90 80.72,17.74 80.72,17.59 arc90 80.97,17.34 80.98,17.34 arc90 81.22,17.59 81.22,17.74 arc-90 81.47,17.98 81.48,17.98 arc-90 81.73,17.74 81.73,17.59 arc90 81.97,17.34 81.98,17.34 arc90 82.23,17.59 82.23,17.74 arc-90 82.48,17.98 82.48,17.98 arc-90 82.73,17.74 82.73,17.59 arc90 82.98,17.34 82.98,17.34 arc90 83.23,17.59 83.23,17.74 arc-90 83.48,17.98 83.48,17.98 arc-90 83.73,17.74 83.73,17.59 arc90 83.98,17.34 83.99,17.34 arc90 84.23,17.59 84.23,17.74 arc-90 84.48,17.98 84.49,17.98 arc-90 84.73,17.74 84.73,17.59 arc90 84.98,17.34 84.99,17.34 arc90 85.24,17.59 85.24,17.74 arc-90 85.48,17.98 85.49,17.98 arc-90 85.74,17.74 85.74,17.59 arc90 85.99,17.34 85.99,17.34 arc90 86.24,17.59 86.24,17.74 arc-90 86.49,17.98 93.72,17.98 96.44,20.7 97.79,20.7 98.81,21.73 v98.81,22.74
D_P  (via drill 0.3)
  Top 0.178: U5.5 62.91,28.2 65.08,26.03 65.08,23.44 65.53,22.99 69.09,22.99 v69.34,23.24
  Top 0.33: R7.2 99.03,27.13 v99.21,26.95
  Bottom 0.178: v69.34,23.24 75.36,23.24 80.31,18.29 93.6,18.29 96.32,21.01 97.41,21.01 98.04,21.64 98.04,25.4 99.21,26.57 v99.21,26.95
EN_3V3_BUCK
  Top 0.254: Q2.3 45.63,2.79 R15.1
EN_VOXL  (via drill 0.3)
  Top 0.178: U4.P$13 17.38,27.29
  Top 0.203: 17.38,27.29 17.91,27.81
  Top 0.254: 17.91,27.81 17.91,30.33 17.75,30.5 16.42,30.5 16.23,30.3 16.23,29.82 v14.92,28.51 14.68,28.27 R20.2 | v14.73,19.18 14.7,19.15 13.16,19.15 12.34,18.33 Q4.3
  Bottom 0.254: v14.73,19.18 14.73,28.32 v14.92,28.51
GND  (via drill 0.3)
  Top 0.127: U2.19 84.32,28.18 84.08,28.42 84.08,28.74 83.47,29.35 82.93,29.35 | 82.09,24.06 82.11,24.08 82.11,24.51 82.8,25.2 C8.2
  Top 0.152: C27.2 16.98,28.23 16.98,26.71 | 16.81,22.56 16.81,22.94 16.59,23.16 C24.2 | v16.51,21.97 16.87,22.33 16.87,22.62
  Top 0.178: C4.1 C7.1 | 15.77,23.95 U4.P$2 | C9.1 80.05,30.14 XTAL1.4 | C10.2 77.95,24.97 77.95,26.29 | 82.93,29.35 80.54,29.35 80.01,28.82 | U4.P$14 16.98,26.71 | v16.51,21.97 16.51,22.26 16.81,22.56 16.87,22.62 U4.P$3 | 82.09,24.06 81.91,23.88 v80.43,23.88 | v91.26,34.92 91.03,34.7
  Top 0.203: v94.23,29.59 93.99,29.35 U1.4 | v16.13,27.56 16.76,26.92 | 16.76,26.92 16.98,26.71 16.98,27.18 16.76,26.96 16.76,26.92
  Top 0.254: v78.99,28.7 79.11,28.82 80.01,28.82 XTAL1.4 | C24.2 15.77,23.95 | X2.25 6.75,17.55 v7.72,17.55 7.3,17.98 X2.24 | 7.69,20.48 X2.19 X2.20 7.19,19.98 7.69,20.48 | 7.69,20.48 v7.72,20.45 | X2.10 6.7,25 7.46,25 7.51,25.04 v8.23,25.04 | X2.7 6.7,26.49 v7.75,26.49 | R10.2 36.78,2.06 Q1.2 | X2.15 X2.16 | X2.12 7.72,23.98 8.23,24.49 v8.23,24.56 | XTAL2.2 56.73,27.01 | 55.18,27.85 C36.1 56.12,27.19 XTAL2.2 | C32.2 65.23,32 R27.2 | C33.2 60.97,23.37 59.82,22.23 59.29,22.23 C35.2 57.6,23.92 XTAL2.4 56.98,23.92 v56.13,24.77 | XTAL2.2 56.01,26.47 v56.01,26.42
  Top 0.305: C13.2 93.12,18.63 93.12,18.44 91.47,18.44 C11.1
  Top 0.381: C1.2 C2.2 | U1.9 v94.23,29.59 | v78.99,26.29 77.95,26.29 XTAL1.2 | R17.1 52.83,3.73 52.83,1.71 53.65,0.89 60.45,0.89 60.52,0.95 | 60.52,0.95 61.21,1.65 61.21,1.78 62.48,1.78 63.12,2.41 63.31,2.22 63.31,1.2 63.06,0.95 60.52,0.95
  Bottom 0.203: v16.51,21.97 16,22.48 16,27.43 v16.13,27.56
  other vias: 56.77,2.67 56.77,3.68 56.77,4.57 56.77,5.71 58.67,6.86 58.04,6.86 57.15,6.86 56.52,6.86 54.74,4.19 29.13,9.19 29.62,9.19 30.1,9.19 29.03,6.5 29.51,6.5 30,6.5 30.48,6.5 30.96,6.5 31.45,6.5 31.93,6.5 45.24,12.52 44.73,12.52 44.22,12.52 43.71,12.52 43.21,12.52 40.89,9.17 44.07,9.14 46.79,12.55 46.25,12.55 45.72,12.55 39.01,42.49 39.52,42.49 40.03,42.49 1.02,26.82 1.02,26.31 1.02,25.83 1.02,25.3 1.02,23.8 1.02,23.32 1.02,22.83 1.02,22.35 0.99,21.84 0.99,21.34 0.99,20.85 0.99,20.37 1.47,20.37 1.47,20.85 1.47,21.34 1.47,21.84 1.5,22.35 1.5,22.83 1.5,23.32 1.5,23.8 1.5,25.3 1.5,25.83 1.5,26.31 1.5,26.82 8.23,26.49 8.71,26.49 7.75,26.01 8.23,26.01 8.71,26.01 9.19,26.01 9.68,25.53 9.19,25.53 8.71,25.53 8.23,25.53 7.75,25.53 7.75,25.04 8.71,25.04 9.19,25.04 9.68,25.04 9.68,24.56 9.19,24.56 8.71,24.56 7.75,24.56 7.72,19.96 8.2,19.96 8.2,20.45 8.69,19.96 8.69,19.48 8.2,19.48 7.72,19.48 7.72,19 8.2,19 8.69,19 8.69,18.52 8.69,18.03 8.69,17.55 8.2,17.55 8.2,18.03 8.2,18.52 26.97,40.11 27.46,40.08 27.94,40.08 28.42,40.08 26.97,39.62 27.43,39.6 27.94,39.6 28.42,39.6 30.05,40.36 33.53,40.36 40.03,40.39 42.04,40.41 46.25,40.26 45.77,40.23 45.29,40.23 44.81,40.23 46.25,39.78 45.77,39.75 45.29,39.75 44.83,39.75 45.9,31.24 46.25,31.57 46.61,31.9 45.42,31.24 46.61,32.38 36.53,31.24 36.04,31.24 37.01,31.27 27.74,31.24 27.36,31.52 27,31.85 27.46,31.98 27.86,31.72 20.32,30.48 20.32,29.84 20.32,29.21 20.95,29.21 21.59,29.21 20.95,29.84 21.59,29.84 20.95,30.48 23.5,11.43 22.86,11.43 22.23,11.43 21.59,11.43 21.59,12.06 22.23,12.06 22.86,12.06 23.5,12.06 23.5,12.7 22.86,12.7 22.23,12.7 21.59,12.7 20.95,11.43 20.95,12.06 20.95,12.7 20.32,12.7 20.32,12.06 20.32,11.43 19.68,11.43 19.68,12.06 19.68,12.7 16.51,15.88 17.14,15.88 17.78,15.88 18.41,15.88 19.05,15.88 19.05,16.51 18.41,16.51 17.78,16.51 17.14,16.51 16.51,16.51 16.51,17.14 17.14,17.14 17.78,17.14 18.41,17.14 19.05,17.14 87.35,34.37 86.84,34.37 91.8,34.9 98.25,33.96 98.25,33.45 98.25,32.97 98.25,32.49 98.25,32 98.25,31.52 96.44,21.51 95.94,21.49 96.93,21.51 41.66,30.86 41.53,34.04 43.94,34.04 40.39,30.61 99.06,10.16 99.06,8.89 99.06,6.35 99.06,7.62 97.79,7.62 97.79,8.89 97.79,19.05 97.79,17.78 97.79,16.51 97.79,15.24 97.79,13.97 97.79,12.7 96.52,12.7 95.25,12.7 96.52,13.97 96.52,15.24 96.52,16.51 96.52,17.78 96.52,19.05 96.52,11.43 95.25,11.43 93.98,11.43 87.63,8.89 88.9,8.89 88.9,7.62 87.63,7.62 87.63,6.35 88.9,6.35 60.96,30.48 59.69,29.21 60.96,29.21 62.23,29.21 49.53,2.54 49.53,3.17 50.16,3.17 50.16,2.54 50.8,2.54 50.8,3.17 96.9,25.91 96.9,26.54 96.9,27.3 96.9,24.26 96.9,23.62 96.9,22.99 62.99,23.11 64.01,23.11 63.5,22.61 63.5,23.62 2.54,35.56 3.81,35.56 3.81,34.29 2.54,34.29 2.54,33.02 3.81,33.02 8.89,43.18 80.92,42.88 80.95,41.17 81.28,34.29 85.22,33.02 85.34,31.75 50.27,11.81 50.27,11.23 39.37,3.81 39.37,4.34 39.9,4.34 98.81,23.62 98.81,24.13 98.81,24.64 98.81,25.15 46.99,27.94 47.24,25.4 48.26,26.67 76.2,30.48 74.93,30.48 72.39,24.13 72.39,25.4 71.12,25.4 71.12,24.13 78.74,21.59 80.01,21.59 80.01,20.32 81.28,20.32 81.28,21.59 90.17,13.97 91.44,13.97 90.17,14.99 15.24,30.48 13.97,30.48 12.7,30.48 12.7,29.21 13.97,29.21 89.66,16.76 89.66,17.27 67.31,38.1 66.04,40.64 67.31,40.64 73.66,41.91 58.42,41.91 45.72,41.91 1.27,40.64 1.27,39.37
  pour Top (rank 6, no thermals): 95.76,28.32 95.76,21.72 100.13,21.72 100.13,28.32
  pour Bottom (isolate 0.406, rank 6, no thermals): -1.27,46.99 -1.27,-1.27 100.33,-1.27 100.33,46.99
  pour Top (isolate 0.406, rank 6, no thermals): -5.08,54.61 -5.08,-6.35 102.87,-6.35 102.87,54.61
  pour Top (rank 6, no thermals): 27.94,11.43 27.94,6.35 48.26,6.35 48.26,12.7 27.94,12.7
  pour Top (rank 6, no thermals): 26.67,40.64 26.67,30.48 46.99,30.48 46.99,40.64
  cutout Bottom: 17.14,25.02 17.14,23.11 18.92,23.11 18.92,20.83 29.46,20.83 29.46,27.43 20.57,27.43 18.92,25.78 18.92,25.02
  pour Top (rank 4, no thermals): 39.88,31.37 45.97,31.37 46.23,31.11 46.23,29.72 47.75,29.72 55.37,22.1 72.26,22.1 73.15,22.99 73.15,30.73 74.68,32.26 82.42,32.26 82.55,32.13 82.68,32.13 84.96,29.84 85.09,29.84 84.96,29.72 84.96,28.19 84.84,28.32 84.33,28.32 83.44,29.21 81.41,29.21 80.52,30.1 80.52,30.73 80.26,30.99 75.18,30.99 74.93,30.73 74.93,22.61 72.9,20.57 53.49,20.57 46.89,27.18 40.04,27.18
  pour Top: 73.66,0 73.66,9.91 92.46,9.91 97.79,15.24 97.79,22.86 101.6,22.86 101.6,0
  pour Top (rank 3, no thermals): -1.27,36.83 7.62,36.83 7.62,45.72 82.55,45.72 82.55,35.56 85.09,33.02 85.09,24.13 87.63,24.13 87.63,20.32 83.82,20.32 81.28,22.86 81.28,31.75 78.74,34.29 78.74,40.64 77.47,41.91 11.43,41.91 11.43,35.56 10.16,34.29 7.62,34.29 7.62,12.7 -1.27,12.7
  pour Bottom: 68.58,25.4 68.58,21.59 74.93,21.59 80.01,16.51 93.98,16.51 96.52,19.05 100.33,19.05 100.33,30.48 97.79,30.48 96.52,29.21 96.52,24.13 85.57,24.13 84.33,25.37 84.33,33.02 81.28,33.02 81.28,24.13 78.74,24.13 78.74,29.21 73.66,29.21 73.66,25.4
  pour Bottom: 1.27,26.67 6.99,26.67 6.99,21.59 1.27,21.59
  pour Bottom (rank 4): 39.37,39.37 41.91,39.37 43.18,38.1 52.07,38.1 59.69,30.48 57.15,27.94 55.88,27.94 49.91,33.91 37.55,33.91
  pour Bottom: 57.02,33.02 57.02,22.86 66.04,22.86 66.04,33.02
  pour Top (rank 4): 88.9,30.48 85.09,30.48 85.09,40.64 82.55,40.64 82.55,44.45 86.36,44.45 86.36,41.91 88.9,39.37
  pour Bottom (rank 4): 87.63,40.64 87.63,44.58 91.31,44.58 95,40.89 95,34.42 88.51,27.93
  pour Top (rank 3): 87.63,41.91 91.44,41.91 91.82,41.53 91.82,35.31 90.17,33.66 90.17,30.48 88.01,30.48 88.01,41.53
  pour Top (rank 3, no thermals): 53.72,34.29 53.34,34.29 49.53,30.48 55.88,24.13 59.69,24.13 62.23,21.59 71.12,21.59 72.39,22.86 72.39,25.4 66.04,25.4 66.04,27.94 67.31,29.21 67.31,34.92 54.36,34.92
  pour Bottom: 35.56,43.18 41.91,43.18 41.91,39.37 57.15,39.37 57.15,35.56 71.12,35.56 71.12,38.1 83.82,38.1 83.82,33.02 88.9,33.02 88.9,46.99 87.63,48.26 35.56,48.26
GPIO0  (via drill 0.3)
  Top 0.152: U2.2 90.59,31.26 v90.58,31.28
  Bottom 0.152: v90.58,31.28 90.58,32.61 XP1.P$1
GPIO1  (via drill 0.3)
  Top 0.127: U2.3 90.19,31.07 90.16,31.1 90.16,31.45 90.3,31.58 90.3,33.02 90.55,33.27 91.64,33.27 91.89,33.53 91.89,34.06 92.33,34.5 v92.33,34.54
  Bottom 0.127: v92.33,34.54 92.33,36.07 XP11.P$1
GPIO2  (via drill 0.3)
  Top 0.127: U2.4 89.79,31.44 90.04,31.69 90.04,34.21 v90.08,34.24
  Bottom 0.127: v90.08,34.24 90.21,34.37 90.21,34.76 XP2.P$1
GPIO3  (via drill 0.3)
  Top 0.127: U2.5 89.39,31.4 89.79,31.79 89.79,33.82 89.66,33.95 89.66,34.54 91.19,36.07 v91.44,36.07
  Bottom 0.127: v91.44,36.07 91.19,36.07 XP3.P$1
GPIO4  (via drill 0.3)
  Top 0.127: U2.6 88.99,31.36 89.53,31.9 89.53,33.71 89.41,33.84 89.41,34.65 89.74,34.98 89.74,37.26 89.53,37.47 89.53,37.68 v89.57,37.72
  Bottom 0.127: v89.57,37.72 90.33,38.48 XP4.P$1
GPIO5  (via drill 0.3)
  Top 0.127: U2.7 88.59,31.32 89.28,32 89.28,33.61 89.15,33.73 89.15,34.75 89.48,35.08 89.48,37.16 89.15,37.49 89.15,37.89 89.41,38.15 v89.41,38.86
  Bottom 0.127: v89.41,38.86 89.41,39.75 XP5.P$1
GPIO6  (via drill 0.3)
  Top 0.127: v88.82,40.72 88.79,40.69 88.79,31.89 88.19,31.3 U2.8
  Bottom 0.127: v88.82,40.72 89.25,41.15 XP10.P$1
GPIO7  (via drill 0.3)
  Top 0.127: U2.9 87.79,31.28 88.52,32 | 87.24,42.67 87.24,42.88 86.89,43.23 85.55,43.23
  Top 0.152: 88.52,32 88.52,40.26 87.24,41.54 87.24,42.67
  Top 0.254: v82.55,44.45 82.7,44.6 84.18,44.6 85.55,43.23 | v44.7,41.78 43.88,41.78 R23.2
  Bottom 0.254: v82.55,44.45 82.4,44.6 67.82,44.6 66.67,43.45 66.67,39.37 65.41,38.1 60.45,38.1 59.05,39.5 59.05,42.55 57,44.6 47.52,44.6 v44.7,41.78
GPIO8_TX1
  Top 0.127: U2.11 87,31.11 86.54,31.57 86.54,31.75 86.25,32.05
  Top 0.254: 86.25,32.05 86.18,32.11 86.18,34.5 87.78,36.1 87.78,39.49 85.65,41.62 85.25,41.62 84.58,42.29 84.58,42.52 X3.P$2
GPIO9_RX1
  Top 0.127: 86,31.75 86.59,31.16 U2.12
  Top 0.254: 86,31.75 85.8,31.95 85.8,34.66 87.4,36.26 87.4,39.34 85.49,41.24 85,41.24 84.33,41.91 X4.P$2
GPIO12  (via drill 0.3)
  Top 0.178: U2.15 85.04,31.43 84.78,31.69 84.78,34.22 v84.71,34.29
  Top 0.254: X2.14 5.6,22.98 5.46,23.11 3.35,23.11 3.25,23.02 2.85,23.02 2.54,23.32 v2.54,24 | v2.55,24.95 2.55,26.66 1.02,28.19 1.02,36.15 1.95,37.08 2.37,37.08 2.49,36.96 3.76,36.96 v3.79,36.93 | v25.78,42.67 34.54,42.67 v34.8,42.42
  Bottom 0.178: v84.71,34.29 84.84,34.42 85.85,34.42
  Bottom 0.254: v2.54,24 v2.54,24.95 v2.55,24.95 | v3.79,36.93 4.1,36.93 4.23,36.8 6.58,36.8 8.26,38.48 8.26,43.84 9.02,44.6 23.86,44.6 v25.78,42.67 | v34.8,42.42 34.8,43.33 36.07,44.6 43.03,44.6 43.43,44.2 43.43,41.27 43.94,40.77 45.59,40.77 48.26,43.43 56.01,43.43 57.78,41.66 57.78,39.12 60.07,36.83 66.93,36.83 68.2,38.1 68.2,41.91 68.07,42.04 68.07,42.29 68.96,43.18 70.99,43.18 72.01,42.16 72.01,40.13 72.77,39.37 78.11,39.37 79.12,40.39 79.12,41.4 79.63,41.91 81.41,41.91 82.8,40.51 86.23,40.51 87.25,39.5 87.25,35.81 85.85,34.42
GPIO22
  Top 0.127: U2.34 87.79,23.36 88.23,22.92 88.23,16.89 87.85,16.51 D7.2
GPIO23
  Top 0.127: U2.35 88.19,23.31 88.48,23.02 88.48,16.51 88.48,15.97 88.48,15.57 88.32,15.41 88.32,14.11 D4.2
GPIO24  (via drill 0.3)
  Top 0.127: U2.36 88.59,23.3 88.74,23.15 v88.74,15.24 | C16.1 83.77,14.86 84.45,14.86 84.88,15.29 v87.63,15.29
  Top 0.254: 78.74,11.3 67.94,11.3 66.42,9.78 D5.2 | 78.74,11.3 78.79,11.3 | 78.74,11.3 81.66,14.22 82.4,14.22 82.96,14.78 C16.1
  Bottom 0.127: v87.63,15.29 87.68,15.24 v88.74,15.24
GPIO25
  Top 0.127: U2.37 88.99,16.42 89.86,15.54 R5.2
GPIO26_ADC0  (via drill 0.3)
  Top 0.178: U2.38 89.39,19.07 v89.41,19.05
  Bottom 0.178: v89.41,19.05 87.63,19.05 XP6.P$1
GPIO27_ADC1  (via drill 0.3)
  Top 0.178: U2.39 89.79,20.16 v89.83,20.11
  Bottom 0.178: v89.83,20.11 88.22,20.11 XP7.P$1
GPIO28
  Top 0.178: D3.2 84.84,22.73 85.34,23.24 85.34,24.27 U2.28
GPIO28_ADC2  (via drill 0.3)
  Top 0.178: U2.40 90.19,22.01 v90.23,21.97
  Bottom 0.178: v90.23,21.97 89.99,21.72 XP8.P$1
GPIO29_ADC3  (via drill 0.3)
  Top 0.178: v93.47,21.59 93.36,21.59 92.82,22.13 91.93,22.13 90.59,23.48 U2.41
  Bottom 0.178: v93.47,21.59 93.09,21.97 XP9.P$1
HUB_RESET  (via drill 0.3)
  Top 0.203: v59.06,31.5 59.73,30.84 U5.15
  Bottom 0.178: 59.69,32.13 59.5,31.94
  Bottom 0.254: TP19.TP 60.07,32.51 59.5,31.94 v59.06,31.5
N$1
  Top 0.152: 90.25,41.83 89.88,42.2 SW1.4
  Top 0.178: 90.25,41.83 90.86,41.22 90.86,37.41 92.08,36.2 92.71,36.2 93.34,36.2 94.11,35.43 R1.1
N$2
  pour Top (no thermals): 17.53,24.77 19.05,24.77 19.3,25.02 19.43,25.15 19.43,25.78 19.81,26.16 20.19,26.16 24.51,26.16 24.77,25.91 24.77,22.35 24.51,22.1 19.81,22.1 19.56,22.35 19.56,22.86 19.18,23.24 19.05,23.37 17.27,23.37 17.27,24.77
N$3
  Top 0.178: U4.P$6 18.18,21.45 18.34,21.3 18.34,20.7 17.73,20.09 C25.1
N$4
  Top 0.254: U3.5 50.55,9.02 50.04,8.51 50.04,4.95 48.77,3.68 48.12,3.68 R16.2 R15.2
N$5
  Top 0.127: 51.55,10.03 U3.4
  Top 0.178: R17.2 52.83,5.45 52.83,9.53 52.32,10.03 51.55,10.03
  Top 0.3: R18.1 R17.2
N$6
  Top 0.3: C20.1 51.49,6.49 U3.6
N$7
  Bottom 0.152: 29.04,42.57 SW2.4
  Bottom 0.254: 29.04,42.57 27.96,43.65 R24.1
N$8  (via drill 0.3)
  other vias: 61.47,10.03 60.96,10.03 60.96,10.54 60.45,10.54 60.45,10.03 54.99,8.76 54.99,9.27 55.5,9.27 55.5,8.76 54.74,5.71 54.74,6.35
  pour Top (isolate 0.254, no thermals): 55.75,8.38 54.86,8.38 54.61,8.64 53.47,8.64 53.47,9.4 54.61,9.4 54.86,9.65 55.75,9.65
  pour Bottom (no thermals): 55.75,8.38 54.74,8.38 54.74,9.65 55.75,9.65 56.01,9.4 59.05,9.4 59.44,9.78 59.44,10.67 59.69,10.92 61.47,10.92 61.98,10.41 61.98,9.65 61.72,9.4 60.33,9.4 59.69,8.76 56.01,8.76 55.75,8.51
  pour Bottom: 55.75,8.51 55.75,5.71 55.37,5.33 54.48,5.33 54.23,5.59 54.23,6.6 54.48,6.86 54.99,6.86 55.24,7.11 55.24,8.51
  pour Top (no thermals): 54.99,5.59 54.99,6.48 54.86,6.6 53.72,6.6 53.72,5.46 54.86,5.46
  pour Top (no thermals): 59.51,10.79 59.51,8.53 62.41,8.53 62.43,8.56 62.43,10.26 61.7,11 59.72,11
N$9  (via drill 0.3)
  Top 0.152: v32.82,34.75 32.33,34.75 32.02,34.44 J2.49
  Top 0.254: D12.C v34.21,41.91
  Bottom 0.152: v32.82,34.75 33.1,34.75 34.21,35.87 v34.21,41.91 34.21,43.56 33.76,44.02 SW2.1
N$10
  Top 0.178: R3.2 81.03,24.56 79.94,25.64 79.94,26.2 | C10.1 79.7,25.96 XTAL1.3
  Top 0.203: 79.94,26.2 XTAL1.3
N$11
  Top 0.152: 18.8,26.92 18.8,28.27 C27.1 R21.2
  Top 0.178: U4.P$11 18.18,26.31
  Top 0.203: 18.18,26.31 18.8,26.92
N$12
  Top 0.254: D12.A 37.93,41.76 R23.1 | R23.1
N$13  (via drill 0.3)
  Top 0.178: U4.P$12 17.78,26.66 v17.9,26.78
  Bottom 0.178: v17.9,26.78 17.02,27.66 TP7.TP
N$14  (via drill 0.3)
  Top 0.178: U4.P$4 17.38,22
  Top 0.203: R21.1 16.83,29.72 16.13,29.02 v16.13,28.45 | v17.29,21.9 17.38,22
  Bottom 0.203: v16.13,28.45 16.69,27.89 16.69,27.33 16.51,27.15 16.51,22.99 17.29,22.21 v17.29,21.9
N$15
  Top 0.254: R22.1 D11.A
N$16  (via drill 0.3)
  Top 0.152: 17.82,21.35 v17.67,21.2
  Top 0.178: U4.P$5 17.78,22.18 17.83,22.13 17.83,21.36 17.82,21.35
  Bottom 0.152: TP6.TP 17,21.2 v17.67,21.2
N$17  (via drill 0.3)
  Top 0.254: R27.1 64.74,30.48 v64.52,30.48 | U5.24 60.21,26.66 v60.21,26.04
  Bottom 0.254: v60.21,26.04 60.21,27.27 60.76,27.81 61.85,27.81 v64.52,30.48
N$19
  pour Top (no thermals): 18.55,27.18 18.55,25.22 18.92,25.22 18.92,26.42 19.18,26.67 20.7,26.67 20.95,26.92 20.95,27.81 20.83,27.94 19.68,27.94 19.56,27.81 19.56,27.56 19.18,27.18
N$20
  Top 0.254: C36.2 54.31,26.62 XTAL2.3 56.68,25.7 58.29,27.3 58.7,27.3 U5.21
N$21  (via drill 0.3)
  Top 0.178: 81.92,14.61 82.17,14.61 83.06,15.49 84.58,15.49 85.26,16.17 D7.1
  Top 0.254: R13.1 15.54,11.3 R12.2 v14.86,8.13 | v14.86,6.1 14.86,1.52 15.37,1.02 32.64,1.02 33.4,1.78 33.4,4.83 33.78,5.21 48.48,5.21 49.01,5.73 49.01,11.95 v48.39,12.57 | v54.74,13.72 55.5,13.72 55.63,13.84 78.02,13.84 78.87,13 D9.1 78.87,12.95 80.52,14.61 81.92,14.61
  Bottom 0.254: v14.86,8.13 v14.86,6.1 | v48.39,12.57 49.53,13.72 v54.74,13.72
N$23
  Top 0.254: C35.1 58.51,25.02 XTAL2.1 58.3,25.41 58.04,25.15 57.53,25.15 57.28,25.4 57.28,25.75 58.45,26.92 59.03,26.92 U5.22
N$24
  Top 0.254: R5.1 91.12,17.18 D1.A
N$25
  Top 0.254: Q2.1 43.37,3.76 R11.2 41.99,3.81 40.64,3.81 39.6,2.77 Q1.3 39.01,2.77 39.75,2.03 39.75,1.27 40.58,0.45 60.64,0.45 60.7,0.51 63.25,0.51 63.75,1.02 63.75,2.41 64.33,2.98 68.71,2.98 D6.2
N$26
  Top 0.178: 56.09,31.83 R26.1
  Top 0.254: R26.1 56.89,32.63 58.61,32.63 U5.14
N$27
  Top 0.254: R9.1 36.83,3.53 Q1.1
N$28
  Top 0.254: U5.13 62.08,33.15 65.84,33.15 R25.1
N$29
  Top 0.152: Q4.1 13.29,15.05 R14.2
  Top 0.254: Q3.3 15.75,14.44 15.38,14.81 R14.2
N$30  (via drill 0.3)
  Top 0.254: R10.1 34.42,1.14 v34.67,0.88 | v69.34,7.11 69.34,7.62 71.25,9.53 80.52,9.53 81.86,10.87 v84.33,10.87 84.68,11.22 D4.1 | v80.64,15.65 80.64,16.76 79.6,17.8 78.94,17.8 D2.1
  Top 0.381: R10.1 R9.2
  Bottom 0.254: v34.67,0.88 39.07,0.88 39.17,0.98 39.57,0.98 39.67,0.88 65.61,0.88 65.71,0.98 66.11,0.98 66.21,0.89 67.82,0.89 69.34,2.41 v69.34,7.11 | v80.64,15.65 84.33,11.96 v84.33,10.87
N$31
  Top 0.254: Q3.1 15.79,12.48 R12.1
N$32
  Top 0.254: D10.A 15.81,2.52 R19.1
N$33
  Top 0.254: R28.1 57.39,30.86 58.23,30.86 U5.17
N$34
  Top 0.254: C34.1 64.04,30.25 64.04,31.12 64.31,31.4 64.31,32.61 64.16,32.76 63.19,32.76 63.04,32.61 63.04,31.65 U5.10
QSPI_SD0
  Top 0.178: U1.5 95.3,29.35 94.89,28.93 92.96,28.93 92.61,28.58 U2.53
QSPI_SD1
  Top 0.152: U1.2 92.84,30.35 92.44,29.96 92.44,29.49 92.33,29.38 U2.55
  Top 0.178: U1.2
QSPI_SD2
  Top 0.152: U2.54 92.35,28.98 92.75,29.38 92.75,29.6 93,29.85 U1.3
QSPI_SD3
  Top 0.178: U2.51 92.88,27.78 93.42,28.32 96.39,28.32 97.04,28.98 97.04,29.96 96.65,30.35 U1.7
QSPI_SLCK
  Top 0.178: U2.52 92.64,28.18 93.09,28.63 96.26,28.63 96.73,29.1 96.73,29.6 96.48,29.85 U1.6
QSPI_SS
  Top 0.152: 93.38,30.86 92.94,30.86 91.86,29.78 U2.56
  Top 0.178: 93.38,30.86 U1.1
  Top 0.254: 93.39,31.75 93.39,31.77 92.98,32.18 R2.1 R1.2 93.83,32.18 93.39,31.75 | 93.39,31.75 U1.1
RUN  (via drill 0.3)
  Top 0.127: U2.26 84.62,25.38 84.47,25.22 84.47,23.86 84,23.39 84,23.38 83.64,23.02 83.64,22.68 83.57,22.61 v83.57,22.38
  Bottom 0.254: TP11.TP 75.06,25.12 77.8,22.38 v83.57,22.38
SBUS_TX  (via drill 0.3, 0.35)
  Top 0.127: U2.16 84.67,29.38 84.33,29.72 84.33,30.73 | 6.66,23.5 X2.13
  Top 0.254: v3.05,25.27 3.05,26.8 1.4,28.45 1.4,35.81 v2.16,36.58 2.29,36.45 6.99,36.45 8.38,37.85 8.38,43.94 9.04,44.6 80.45,44.6 81.54,43.51 v81.54,40.38 | v3.05,23.5 6.66,23.5 | 84.33,30.73 84.33,32.51 82.93,33.91 v82.55,33.91
  Bottom 0.152: TP9.TP 2.16,37.21 v2.16,36.58
  Bottom 0.254: v3.05,25.27 v3.05,23.5 | v82.55,33.91 81.84,34.62 81.84,40.08 v81.54,40.38
SCL0  (via drill 0.3)
  Top 0.127: v85.98,22.1 86.99,23.11 U2.32
  Top 0.254: v3.99,22.23 4.03,22.23 5.28,20.98 X2.18 | v3.99,25.27 3.99,29.52 4.83,30.35 4.83,35.05 5.46,35.69 7.91,35.69 9.27,37.05 9.27,42.76 10.41,43.9 79.55,43.9 80.26,43.18 80.26,34.16 81.79,32.64 82.68,32.64 82.93,32.38 v82.93,31.62
  Bottom 0.178: TP17.TP 5.2,25.27 4.75,25.71 4.39,25.71 4.13,25.46 4.13,25.41 v3.99,25.27
  Bottom 0.254: v3.99,22.23 v3.99,25.27 | v82.93,31.62 82.93,24.64 85.47,22.1 v85.98,22.1
SCL_VOXL
  Top 0.127: U2.18 84.59,28.58 83.57,29.61 83.57,29.72
  Top 0.178: 83.57,29.72 81.79,31.5 74.93,31.5 74.04,30.61 74.04,22.48 72.77,21.21 54.61,21.21 47.12,28.7 45.85,28.7 arc90 45.6,28.45 arc-90 45.35,28.21 45.34,28.21 arc-90 45.1,28.45 45.1,28.95 arc90 44.85,29.2 44.84,29.2 arc90 44.59,28.95 44.59,28.45 arc-90 44.34,28.21 44.34,28.21 arc-90 44.09,28.45 44.09,28.95 arc90 43.84,29.2 43.83,29.2 arc90 43.59,28.95 43.59,28.45 arc-90 43.34,28.21 43.33,28.21 arc-90 43.08,28.45 42.97,28.56 arc-90 42.97,28.91 arc90 42.97,29.26 42.95,29.29 arc90 42.59,29.29 arc-90 42.24,29.29 41.02,30.52 J2.13
SDA0  (via drill 0.3)
  Top 0.127: v85.66,22.59 86.06,22.59 86.59,23.13 U2.31
  Top 0.254: X2.17 5.32,21.48 4.57,22.23 v4.57,22.48 | v4.57,25.27 4.57,25.91 4.37,26.11 4.37,29.36 5.21,30.2 5.21,34.8 5.52,35.12 5.71,35.31 8.06,35.31 9.65,36.9 9.65,42.6 10.57,43.52 71.63,43.52 arc-90 71.91,43.23 71.91,43.2 arc90 72.2,42.91 72.31,42.91 arc90 72.59,43.2 72.59,43.23 arc-90 72.88,43.52 72.98,43.52 arc-90 73.27,43.23 73.27,43.2 arc90 73.56,42.91 73.66,42.91 arc90 73.95,43.2 73.95,43.23 arc-90 74.23,43.52 74.34,43.52 arc-90 74.63,43.23 74.63,43.2 arc90 74.91,42.91 75.02,42.91 arc90 75.3,43.2 75.3,43.23 arc-90 75.59,43.52 75.7,43.52 arc-90 75.98,43.23 75.98,43.2 arc90 76.27,42.91 76.37,42.91 arc90 76.66,43.2 76.66,43.23 arc-90 76.94,43.52 77.05,43.52 arc-90 77.34,43.23 77.34,43.2 arc90 77.62,42.91 77.73,42.91 arc90 78.02,43.2 78.02,43.23 arc-90 78.3,43.52 79.39,43.52 79.88,43.02 79.88,34.01 81.73,32.16 v82.45,32.16
  Bottom 0.178: v4.57,22.48 5.21,22.48 TP16.TP
  Bottom 0.254: v4.57,22.48 v4.57,25.27 | v82.45,32.16 82.51,32.1 83.13,32.1 83.41,31.82 83.41,31.42 83.31,31.32 83.31,24.8 85.52,22.59 v85.66,22.59
SDA_VOXL
  Top 0.127: U2.17 84.56,28.98 83.95,29.59 83.95,29.77
  Top 0.178: J2.15 40.52,34.3 40.77,34.54 44.45,34.54 44.83,34.16 44.83,29.84 45.59,29.08 47.17,29.08 54.74,21.51 72.64,21.51 73.74,22.61 73.74,30.73 74.8,31.8 81.91,31.8 83.95,29.77
SW1  (via drill 0.3)
  Top 0.254: X2.11 0.75,24.48 0.4,24.13 0.4,8.99 1.02,8.38 7.11,8.38 8.76,6.73 v8.76,1.42 9.78,0.4 39.27,0.4 v39.37,0.5 | D6.1 D5.1 66.42,1.01 v65.91,0.5
  Bottom 0.254: v65.91,0.5 v39.37,0.5 | v8.76,1.42 7.96,1.42 TP8.TP
SWCLK  (via drill 0.3)
  Top 0.127: U2.24 84.4,26.18 83.96,25.74 83.96,24.07 83.92,24.03 83.82,23.93 83.5,23.6 83.5,23.59 83.21,23.3 v82.86,23.3
  Bottom 0.254: SWCLK.TP 76.73,25.88 76.73,24.52 77.95,23.3 v82.86,23.3
SWDIO  (via drill 0.3)
  Top 0.127: U2.25 84.44,25.78 84.21,25.55 84.21,23.96 83.75,23.5 83.75,23.49 83.23,22.97 v83.23,22.86
  Bottom 0.254: SWDIO.TP 75.44,26.54 75.44,25.28 77.89,22.82 83.19,22.82 v83.23,22.86
USB-WIFI_N  (via drill 0.3)
  Top 0.254: U5.2 62.24,26.85 v62.24,26.42
  Bottom 0.254: v62.23,26.42 v62.24,26.42 62.37,26.29 62.37,25.41 62.23,25.27 61.59,25.27 61.22,25.65 W1.USB-DM
USB-WIFI_P  (via drill 0.3)
  Top 0.254: U5.3 64.14,25.68 v64.14,25.53
  Bottom 0.254: v64.14,25.53 63.6,25.53 W1.USB-DP
USB_D_N
  Top 0.127: U2.46 92.97,25.78 93.85,24.89 97.22,24.89 97.65,24.46 R6.1
USB_D_P
  Top 0.127: U2.47 92.93,26.18 93.96,25.15 97.02,25.15 97.58,25.7 R7.1
VOXL_EN_BUCK  (via drill 0.3)
  Top 0.178: J2.7 v42.52,34.01 | R8.2 79.74,19.86 77.85,17.98
  Top 0.254: v42.43,28.42 42.55,28.31 42.55,24.84 43.67,23.71 48.27,23.71 49.12,22.86 49.12,19.53 49.68,18.97 76.85,18.97 77.85,17.98 77.85,16.81 D2.2 D9.2 | R8.2 84.72,19.86 D3.1
  Bottom 0.254: v42.43,28.42 42.43,33.92 v42.52,34.01
VOXL_USB_N  (via drill 0.3)
  Top 0.254: J2.12 41.52,37.64 v41.69,37.64 | v57.26,29.58 57.2,29.52 58.02,28.7 U5.19
  Bottom 0.254: v41.69,37.64 41.98,37.34 49.18,37.34 52.38,34.13 arc90 52.79,34.13 52.88,34.23 arc-90 53.28,34.23 53.3,34.21 arc-90 53.3,33.8 53.21,33.71 arc90 53.21,33.31 53.23,33.29 arc90 53.63,33.29 53.72,33.38 arc-90 54.13,33.38 54.15,33.36 arc-90 54.15,32.96 54.05,32.87 arc90 54.05,32.46 56.94,29.58 v57.26,29.58 57.25,29.57
VOXL_USB_P  (via drill 0.3)
  Top 0.254: J2.14 41.02,37.64 v40.85,37.64 | U5.20 58.6,27.93 58.23,27.93 57.17,28.99 v56.67,28.99
  Bottom 0.254: v40.85,37.64 41.53,36.96 49.02,36.96 56.77,29.21 56.77,29.08 v56.67,28.99
XIN
  Top 0.152: XTAL1.1 77.94,28.05 78.47,27.52 80.51,27.52 81.64,28.65 81.64,28.72 81.87,28.95 83.48,28.95 83.81,28.63 83.81,28.06 84.21,27.66 84.43,27.66 84.55,27.78 U2.20
  Top 0.178: C9.2 78.28,29.16 XTAL1.1
XOUT
  Top 0.152: U2.21 84.09,27.38 83.53,27.94 83.53,28.51 83.37,28.67 82.11,28.67 81.92,28.48 81.92,28.32 arc-90 81.68,28.09 81.61,28.09 arc90 81.38,27.85 81.38,27.75 arc90 81.61,27.51 81.68,27.51 arc-90 81.92,27.28 81.92,26.49 R3.1

## Text on the board
tPlace: Fastboot SW | FB | HB | 3V3 | 5V
bPlace: TX / RX | IO6 | IO5 | IO4 | IO1 | IO3 | IO2 | IO0 | A3 | A0 | A2 | A1
tNames: BOOTSEL
bNames: RUN